# Altium schematic sheet Sheet1.SchDoc
size 381 x 241 mm; SheetNumber: 1; SheetTotal: 1
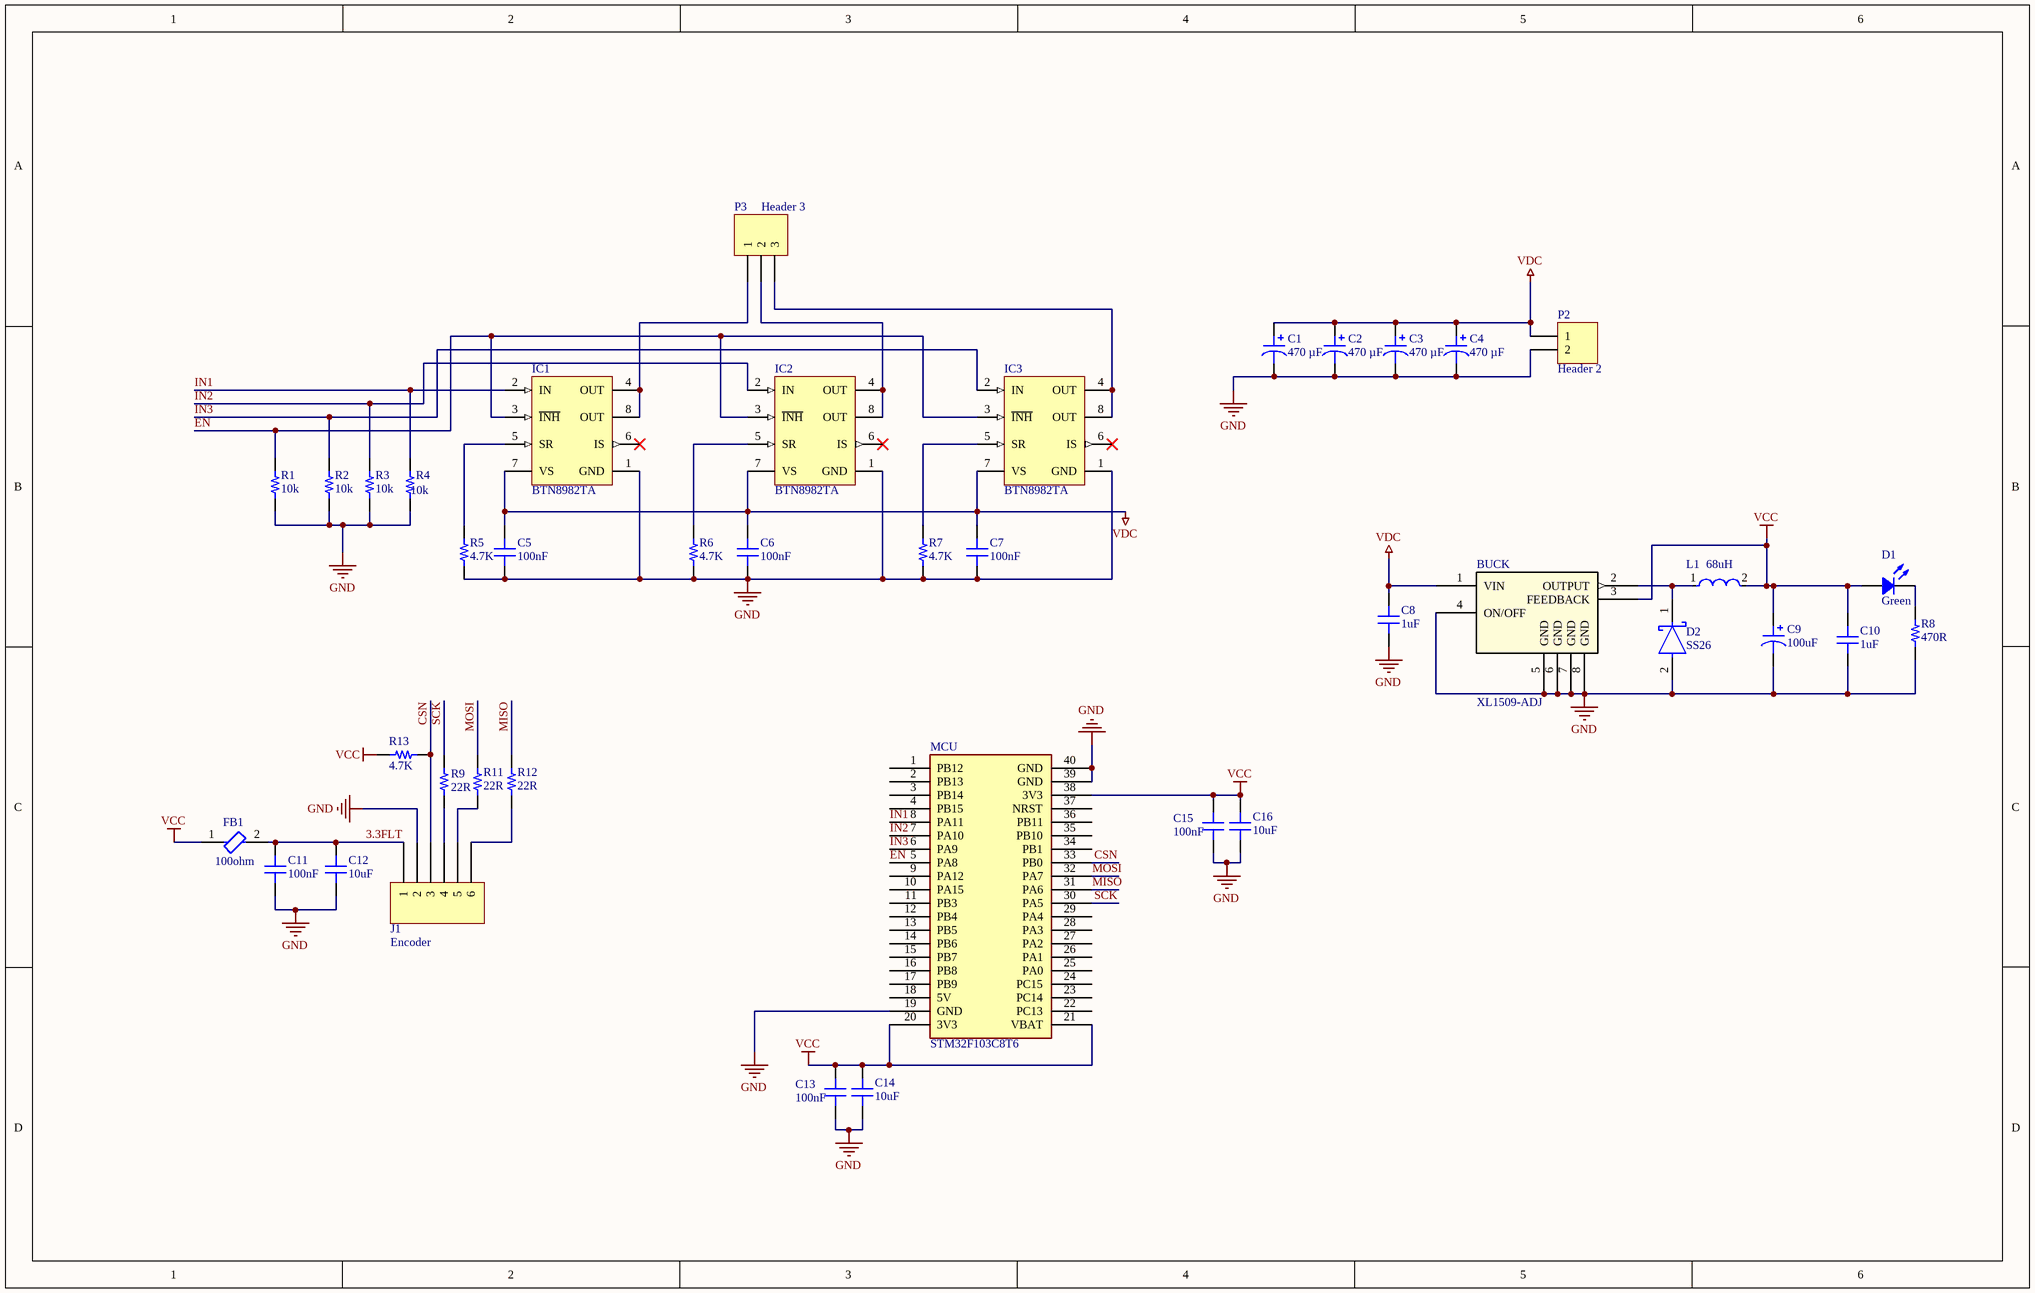
[diagram p0: Sheet1.SchDoc]

## Parts
BUCK  XL1509-ADJ  [SOIC-8_YTS]
C1  470 µF  [CAP TH ALPOLY D10.00mm S5.00mm H11.50mm]
C2  470 µF  [CAP TH ALPOLY D10.00mm S5.00mm H11.50mm]
C3  470 µF  [CAP TH ALPOLY D10.00mm S5.00mm H11.50mm]
C4  470 µF  [CAP TH ALPOLY D10.00mm S5.00mm H11.50mm]
C5  Capacitance: 100nF  [CAP 0805_2012]  (hidden comment: 10000 pF)
C6  Capacitance: 100nF  [CAP 0805_2012]  (hidden comment: 10000 pF)
C7  Capacitance: 100nF  [CAP 0805_2012]  (hidden comment: 10000 pF)
C8  Capacitance: 1uF  [CAP 0805_2012]  (hidden comment: 10000 pF)
C9  100uF  [CAP ALSMD 6.6MM H8.0MM]
C10  Capacitance: 1uF  [CAP 0805_2012]  (hidden comment: 100uF)
C11  Capacitance: 100nF  [CAP 0805_2012]  (hidden comment: 10000 pF)
C12  Capacitance: 10uF  [CAP 0805_2012]  (hidden comment: 10000 pF)
C13  Capacitance: 100nF  [CAP 0805_2012]  (hidden comment: 10000 pF)
C14  Capacitance: 10uF  [CAP 0805_2012]  (hidden comment: 10000 pF)
C15  Capacitance: 100nF  [CAP 0805_2012]  (hidden comment: 10000 pF)
C16  Capacitance: 10uF  [CAP 0805_2012]  (hidden comment: 10000 pF)
D1  Green  [LED 0805_2012 GREEN]
D2  SS26  [FP-S8-V-3848_01-003-MFG]
FB1  100ohm  [FP-BLM21-0_2-t0_85-e0_5-IPC_A]
IC1  BTN8982TA  [INF-PG-TO263-7-1_L]
IC2  BTN8982TA  [INF-PG-TO263-7-1_L]
IC3  BTN8982TA  [INF-PG-TO263-7-1_L]
J1  Encoder  [JST XH B6B-XH-A]
L1  68uH  [FP-CDRH104R-MFG]
MCU  STM32F103C8T6  [Stm32 BluePill]
P2  Header 2  [HDR1X2]
P3  Header 3  [HDR1X3]
R1  10k  [RES 0805_2012]
R2  10k  [RES 0805_2012]
R3  10k  [RES 0805_2012]
R4  10k  [RES 0805_2012]
R5  4.7K  [RES 0805_2012]
R6  4.7K  [RES 0805_2012]
R7  4.7K  [RES 0805_2012]
R8  470R  [RES 0805_2012]
R9  22R  [RES 0805_2012]
R11  22R  [RES 0805_2012]
R12  22R  [RES 0805_2012]
R13  4.7K  [RES 0805_2012]

## Nets
GND: BUCK.4(ON/OFF) BUCK.5(GND) BUCK.6(GND) BUCK.7(GND) BUCK.8(GND) C1.2 C2.2 C3.2 C4.2 C5.1 C6.1 C7.1 C8.1 C9.2 C10.1 C11.1 C12.1 C13.1 C14.1 C15.1 C16.1 D2.2(A) IC1.1(GND) IC2.1(GND) IC3.1(GND) J1.2 MCU.19(GND) MCU.39(GND) MCU.40(GND) P2.2 R1.1 R2.1 R3.1 R4.1 R5.1 R6.1 R7.1 R8.1
VCC: BUCK.3(FEEDBACK) C9.1 C10.2 C13.2 C14.2 C15.2 C16.2 D1.1 FB1.1 L1.2 MCU.20(3V3) MCU.21(VBAT) MCU.38(3V3) R13.2
VDC: BUCK.1(VIN) C1.1 C2.1 C3.1 C4.1 C5.2 C6.2 C7.2 C8.2 IC1.7(VS) IC2.7(VS) IC3.7(VS) P2.1
3.3FLT: C11.2 C12.2 FB1.2 J1.1
CSN: J1.3 MCU.33(PB0) R13.1
EN: IC1.3(~{INH}) IC2.3(~{INH}) IC3.3(~{INH}) MCU.5(PA8) R1.2
IN1: IC1.2(IN) MCU.8(PA11) R4.2
IN2: IC2.2(IN) MCU.7(PA10) R3.2
IN3: IC3.2(IN) MCU.6(PA9) R2.2
MISO: MCU.31(PA6) R12.1
MOSI: MCU.32(PA7) R11.1
SCK: MCU.30(PA5) R9.2
NetBUCK_2: BUCK.2(OUTPUT) D2.1(C) L1.1
NetD1_2: D1.2 R8.2
NetIC1_4: IC1.4(OUT) IC1.8(OUT) P3.1
NetIC1_5: IC1.5(SR) R5.2
NetIC2_4: IC2.4(OUT) IC2.8(OUT) P3.2
NetIC2_5: IC2.5(SR) R6.2
NetIC3_4: IC3.4(OUT) IC3.8(OUT) P3.3
NetIC3_5: IC3.5(SR) R7.2
NetJ1_4: J1.4 R9.1
NetJ1_5: J1.5 R11.2
NetJ1_6: J1.6 R12.2

Not connected (* = marked no-connect by the designer): IC1 6(IS)*; IC2 6(IS)*; IC3 6(IS)*; MCU 1(PB12) 2(PB13) 3(PB14) 4(PB15) 9(PA12) 10(PA15) 11(PB3) 12(PB4) 13(PB5) 14(PB6) 15(PB7) 16(PB8) 17(PB9) 18(5V) 22(PC13) 23(PC14) 24(PC15) 25(PA0) 26(PA1) 27(PA2) 28(PA3) 29(PA4) 34(PB1) 35(PB10) 36(PB11) 37(NRST)

## Library data of the parts
BUCK = XL1509-ADJ: Description; Manufacturer_Name: UMW(Youtai Semiconductor Co., Ltd.); Copyright: Copyright (C) 2026 Ultra Librarian. All rights reserved.; Manufacturer_Part_Number: XL1509-ADJ; RefDes: RefDes; Type: Type
C1-C4 = APSC160ELL471MJB5S: CAP ALUM POLY 470UF 20% 16V T/H; manufacturer: United Chemi-Con; ESR (Equivalent Series Resistance): 10mOhm; Lifetime @ Temp.: 2000 Hrs @ 105°C; Ripple Current @ High Frequency: 6.1 A @ 100 kHz; Type: Polymer; Part Number: APSC160ELL471MJB5S; Value: 470 µF; Applications: General Purpose; Capacitance: 470 µF; componentlink1description: Datasheet; componentlink1url: http://www.chemi-con.co.jp/cgi-bin/CAT_DB/SEARCH/cat_db_al.cgi?e=e&j=p&pdfname=psc; componentlink2description: DigiKey Link; componentlink2url: https://www.digikey.com/en/products/detail/united-chemi-con/APSC160ELL471MJB5S/1826698; Device Package: Radial, Can; Height - Seated (Max): 0.453" (11.50mm); lastupdated: 4/5/2026 21:04:37; Lead Spacing: 0.197" (5.00mm); Lifecycle Status: Active; Minimum Order: 1; Mounting Type: Through Hole; Operating Temperature: -55°C ~ 105°C; Package / Case: Radial, Can; packaging: Bulk; partid: 3587; Part Status: Active; price: 0.89; series: NPCAP™-PSC; Size / Dimension: 0.394" Dia (10.00mm); Supplier 1: DigiKey; Supplier Part Number 1: 565-3234-ND; Tolerance: ±20%; Voltage - Rated: 16 V
C5-C8 C10-C16 = C0805C103K5RACTU: CAP CER 10000PF 50V X7R 0805; manufacturer: KEMET; Tolerance: ±10%; Part Number: C0805C103K5RACTU; Applications: Bypass, Decoupling; componentlink1description: Datasheet; componentlink1url: https://api.kemet.com/component-edge/download/datasheet/C0805C103K5RACTU.pdf; componentlink2description: DigiKey Link; componentlink2url: https://www.digikey.com/en/products/detail/kemet/C0805C103K5RACTU/411157; Device Package: 0805 (2012 Metric); lastupdated: 4/6/2026 19:33:13; Lifecycle Status: Active; Minimum Order: 1; Mounting Type: Surface Mount, MLCC; Operating Temperature: -55°C ~ 125°C; Package / Case: 0805 (2012 Metric); packaging: TapeAndReel; partid: 74789; Part Status: Active; price: 0.01; series: SMD Comm X7R; Size / Dimension: 0.079" L x 0.049" W (2.00mm x 1.25mm); Supplier 1: DigiKey; Supplier Part Number 1: 399-C0805C103K5RACTUCT-ND; Temperature Coefficient: X7R; Thickness (Max): 0.035" (0.88mm); value: 10000 pF; Voltage - Rated: 50V
C9 = EHBSA035M1010608T: CAP ALUM HYBRID 0608 35V 100UF; Part Number: EHBSA035M1010608T
D1 = QTLP630C4TR: LED GREEN CLEAR 0805 SMD; Manufacturer: Everlight Electronics Co Ltd; Configuration: Standard; Current - Test: 20mA; Lens Color: Colorless; Lens Size: 1.40mm x 1.25mm; Lens Style: Rectangle with Flat Top; Millicandela Rating: 10mcd; Viewing Angle: 140°; Voltage - Forward (Vf) (Typ): 2.1V; Wavelength - Dominant: 570nm; Wavelength - Peak: 565nm; Part Number: QTLP630C4TR; Color: Green; ComponentLink1Description: Datasheet; ComponentLink1URL: //media.digikey.com/PDF/Data%20Sheets/Everlight%20PDFs/QTLP630-2.pdf; ComponentLink2Description: DigiKey Link; ComponentLink2URL: https://www.digikey.com/en/products/detail/everlight-electronics-co-ltd/QTLP630C4TR/2675902; Device Package: 0805 (2012 Metric); Height (Max): 1.20mm; LastUpdated: 4/5/2026 20:39:04; Lens Transparency: Clear; Lifecycle Status: Active; Minimum Order: 1; Mounting Type: Surface Mount; Package / Case: 0805 (2012 Metric); Packaging: TapeAndReel; PartId: 240; Part Status: Active; Price: 0.05; Series: -; Size / Dimension: 2.00mm L x 1.25mm W; Supplier 1: DigiKey; Supplier Part Number 1: 1080-1411-1-ND; Supplier Device Package: 0805; Value: Green
D2 = CMP-02539-000064-1: DIODE SCHOTTKY 60V 2A DO214AC; RoHS Compliant: Yes
FB1 = CMP-06046-002791-1: Chip Ferrite Bead, 0805, 420Ω @ 100MHz, 0.3Ω, 25%, 300mA
IC1-IC3 = CMP-1114-00014-1: High Current PN Half Bridge, 5.5 to 40 V, 7 uA Iq, PG-TO263-7, Reel, Green; Manufacturer: Infineon; Inhibit: TRUE; Iq (typ): 7 uA; Group: NovalithIC; ID(lim): 77 A; RDS (on): 10; Protect: UV, OT, OC; ID(lim) (min): 55 A; Diagnosis: OT, OC-failure flag, current sense; ComponentLink2Description: Datasheet; Packing: Reel; PackageDescription: 7-Pin Plastic (Green) Transistor Single Outline Package, 9.25 x 10 mm Body, 1.27 mm Pitch; PackageVersion: May-07; PackageReference: PG-TO263-7-1; ComponentLink2URL: http://www.infineon.com/dgdl/BTN8982TA-Data-Sheet-rev10-Infineon.pdf?folderId=db3a30431ff98815012060aedcd46179&fileId=db3a30433fa9412f013fbe32289b7c17; Operating Range: 5.5 to 40 V; ComponentLink1Description: Manufacturer URL; Green: TRUE; Mounting: SMT; PartNumber: BTN8982TA; ComponentLink3URL: http://www.infineon.com/dgdl/BTN8982TA-Data-Sheet-rev10-Infineon.pdf?folderId=db3a30431ff98815012060aedcd46179&fileId=db3a30433fa9412f013fbe32289b7c17&ack=t; ComponentLink1URL: http://www.infineon.com/; Halogen-free: TRUE; Mounting Technology: Surface Mount; ComponentLink3Description: Package Specification; DatasheetVersion: Rev. 1.0
J1 = B6B-XH-A(LF)(SN): CONN HEADER VERT 6POS 2.5MM; Manufacturer: JST Sales America Inc.; Contact Length - Post: 0.134" (3.40mm); Current Rating (Amps): 3A; Material Flammability Rating: UL94 V-0; Number of Positions: 6; Number of Positions Loaded: All; Pitch - Mating: 0.098" (2.50mm); Shrouding: Shrouded - 4 Wall; Style: Board to Cable/Wire; Voltage Rating: 250V; Part Number: B6B-XH-A(LF)(SN); ComponentLink1Description: Datasheet; ComponentLink1URL: http://www.jst-mfg.com/product/pdf/eng/eXH.pdf; ComponentLink2Description: DigiKey Link; ComponentLink2URL: http://digikey.com/product-detail/en/jst-sales-america-inc/B6B-XH-A-LF-SN/455-2271-ND/1000381; Connector Type: Header; Contact Finish - Mating: Tin; Contact Finish - Post: Tin; Contact Material: Brass; Contact Shape: Square; Contact Type: Male Pin; Fastening Type: Detent Lock; Insulation Color: Natural; Insulation Height: 0.276" (7.00mm); Insulation Material: Polyamide (PA66), Nylon 6/6; LastUpdated: 1/12/2020 23:46:58; Lifecycle Status: Active; Minimum Order: 1; Mounting Type: Through Hole; Number of Rows: 1; Operating Temperature: -25°C ~ 85°C; Packaging: Bulk; PartId: 71; Part Status: Active; Price: 0.27; Series: XH; Supplier 1: DigiKey; Supplier Part Number 1: 455-2271-ND; Termination: Press-Fit, Solder
L1 = CMP-48855-000006-1: FIXED IND 5.2UH 6A 22 MOHM SMD; Core Material: Ferrite; Max DC Current: 5.4A; Rated Current-Max: 5.5A; Test Frequency: 100kHz; Saturation Current: 5.6A; Tolerance: 30%; DC Resistance (DCR): 22mR; Shielding: Shielded; Depth: 10.3mm; Lead Free: Lead Free; Series: CDRH; Min Operating Temperature: -40°C; Mount: Surface Mount; Max Operating Temperature: 100°C; Termination: SMD/SMT; Width: 0.394inch; Radiation Hardening: No; Package Quantity: 1; Height: 4mm; Height - Seated (Max): 0.157inch; Military Standard: Not; Inductance: 5.2uH; Length: 10.5mm; Packaging: Tape and Reel; DC Current: 5.4A; Case/Package: Nonstandard; Current Rating: 5.4A
MCU = BluePill: Designed By @Alixahedi
P2 = Header 2: Header, 2-Pin; LatestRevisionDate: 17-Jul-2002; LatestRevisionNote: Re-released for DXP Platform.; Publisher: Altium Limited
P3 = Header 3: Header, 3-Pin; LatestRevisionDate: 17-Jul-2002; LatestRevisionNote: Re-released for DXP Platform.; Publisher: Altium Limited
R1-R9 R11-R13 = CRGP0805F470R: RES 470 OHM 1% 1/3W 0805; Part Number: CRGP0805F470R